# Altium schematic sheet Connector-Sheet.SchDoc
size A4; SheetNumber: 5; SheetTotal: 5
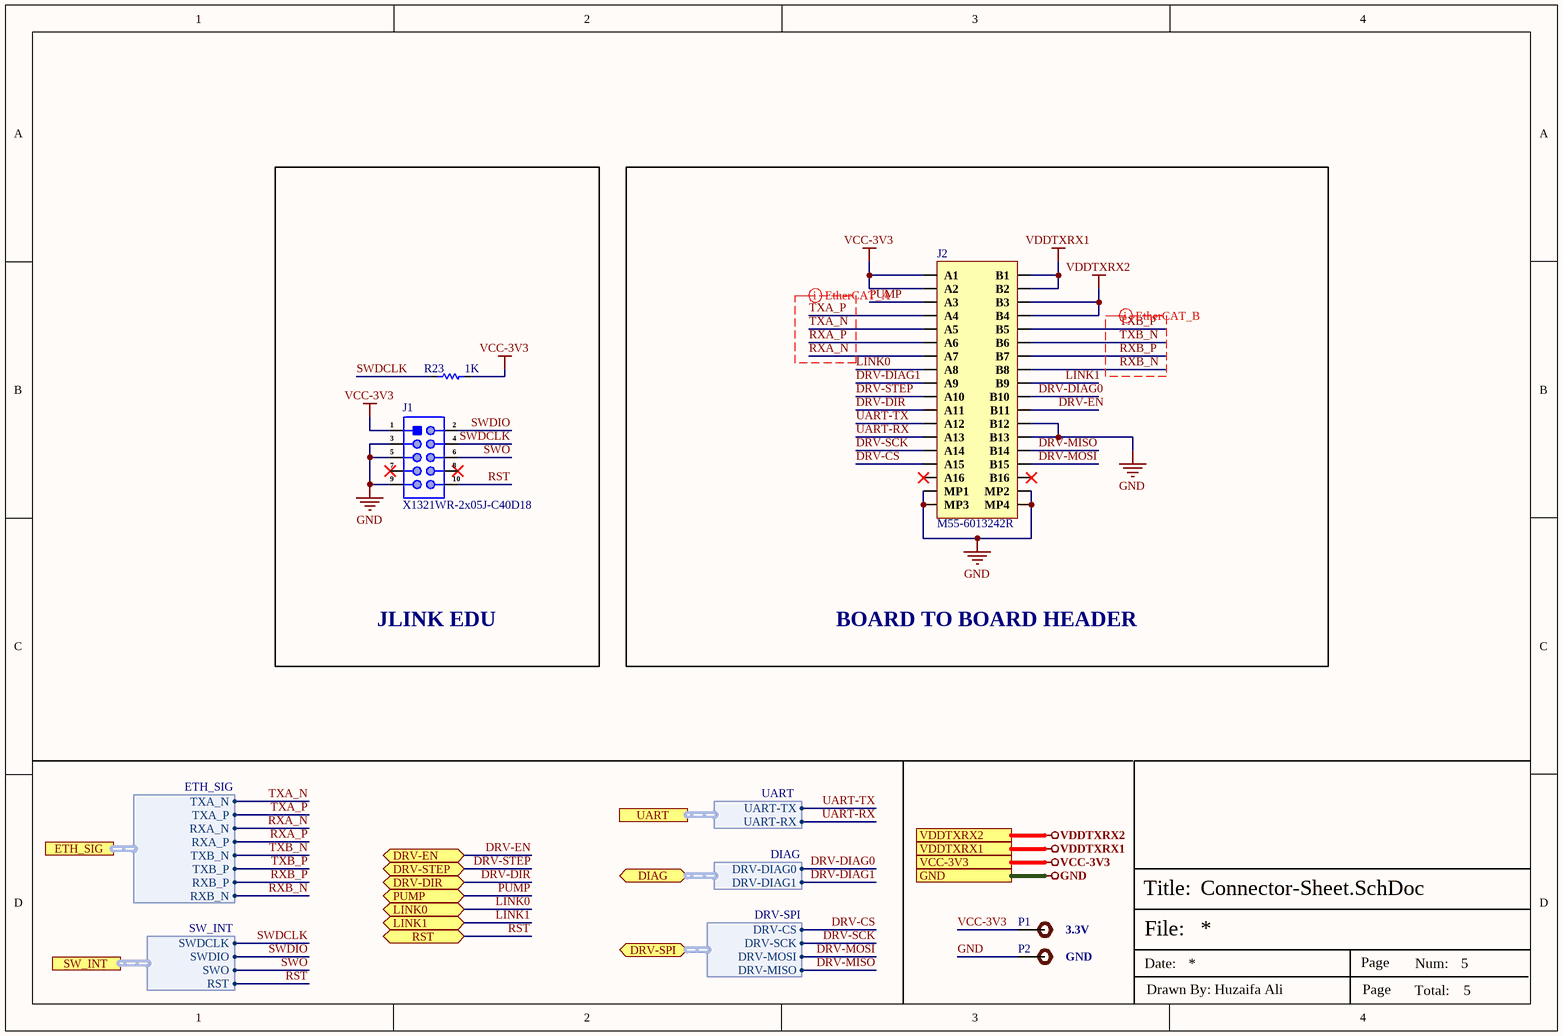
[diagram p0: Connector-Sheet.SchDoc]

## Parts
J1  X1321WR-2x05J-C40D18  [X1321WR-2x05J-C40D18]
J2  M55-6013242R  [M55-6013242R]
P1  TEST POINT  [Test-point]  (value not drawn)
P2  TEST POINT  [Test-point]  (value not drawn)
R23  1K  [Res-0201]

## Blocks framed on the sheet
JLINK EDU: J1 R23
BOARD TO BOARD HEADER: J2

## Ports
DIAG (bidir, harness DIAG, see Top-Sheet[3B], Controller-Sheet-2[2D]), DRV-DIR (bidir, see Top-Sheet[3B], Controller-Sheet-2[3D]), DRV-EN (bidir, see Top-Sheet[3B], Controller-Sheet-2[3D]), DRV-SPI (bidir, harness DRV-SPI, see Top-Sheet[3B], Controller-Sheet-2[2D]), DRV-STEP (bidir, see Top-Sheet[3B], Controller-Sheet-2[3D]), ETH_SIG (harness ETH_SIG, see Top-Sheet[3B], Controller-Sheet-2[1D]), GND (see Top-Sheet[3A], Controller-Sheet-1[2D], Controller-Sheet-2[3D], Encoder-Sheet[3D]), LINK0 (bidir, see Top-Sheet[3C], Controller-Sheet-1[3D]), LINK1 (bidir, see Top-Sheet[3C], Controller-Sheet-1[3D]), PUMP (bidir, see Top-Sheet[3B], Controller-Sheet-2[3D]), RST (bidir, see Top-Sheet[3B], Controller-Sheet-1[2D], Controller-Sheet-2[3D]), SW_INT (harness SW_INT, see Top-Sheet[3B], Controller-Sheet-2[2D]), UART (harness UART, see Top-Sheet[3B], Controller-Sheet-2[1D]), VCC-3V3 (see Top-Sheet[3B], Controller-Sheet-1[2D], Controller-Sheet-2[3D], Encoder-Sheet[2D]), VDDTXRX1 (see Top-Sheet[3B], Controller-Sheet-1[3D]), VDDTXRX2 (see Top-Sheet[3B], Controller-Sheet-1[3D])

## Harnesses
DIAG: DRV-DIAG0, DRV-DIAG1
DRV-SPI: DRV-CS, DRV-SCK, DRV-MOSI, DRV-MISO
UART: UART-TX, UART-RX
SW_INT: SWDCLK, SWDIO, SWO, RST
ETH_SIG: TXA_N, TXA_P, RXA_N, RXA_P, TXB_N, TXB_P, RXB_P, RXB_N

## Nets
GND: J1.3 J1.5 J1.9 J2.B12 J2.B13 J2.MP1 J2.MP2 J2.MP3 J2.MP4 P2.1 ; port GND
VCC-3V3: J1.1 J2.A1 J2.A2 P1.1 R23.2 ; port VCC-3V3
VDDTXRX1: J2.B1 J2.B2 ; port VDDTXRX1
VDDTXRX2: J2.B3 J2.B4 ; port VDDTXRX2
DRV-CS: J2.A15 ; port DRV-SPI.DRV-CS
DRV-DIAG0: J2.B10 ; port DIAG.DRV-DIAG0
DRV-DIAG1: J2.A9 ; port DIAG.DRV-DIAG1
DRV-DIR: J2.A11 ; port DRV-DIR
DRV-EN: J2.B11 ; port DRV-EN
DRV-MISO: J2.B14 ; port DRV-SPI.DRV-MISO
DRV-MOSI: J2.B15 ; port DRV-SPI.DRV-MOSI
DRV-SCK: J2.A14 ; port DRV-SPI.DRV-SCK
DRV-STEP: J2.A10 ; port DRV-STEP
LINK0: J2.A8 ; port LINK0
LINK1: J2.B9 ; port LINK1
PUMP: J2.A3 ; port PUMP
RST: J1.10 ; port RST, port SW_INT.RST
RXA_N: J2.A7 ; port ETH_SIG.RXA_N
RXA_P: J2.A6 ; port ETH_SIG.RXA_P
RXB_N: J2.B8 ; port ETH_SIG.RXB_N
RXB_P: J2.B7 ; port ETH_SIG.RXB_P
SWDCLK: J1.4 R23.1 ; port SW_INT.SWDCLK
SWDIO: J1.2 ; port SW_INT.SWDIO
SWO: J1.6 ; port SW_INT.SWO
TXA_N: J2.A5 ; port ETH_SIG.TXA_N
TXA_P: J2.A4 ; port ETH_SIG.TXA_P
TXB_N: J2.B6 ; port ETH_SIG.TXB_N
TXB_P: J2.B5 ; port ETH_SIG.TXB_P
UART-RX: J2.A13 ; port UART.UART-RX
UART-TX: J2.A12 ; port UART.UART-TX

Not connected (* = marked no-connect by the designer): J1 7* 8*; J2 A16* B16*

## Layout directives
differential pair; differential pair class EtherCAT_A_Lines; net class EtherCAT_A; rule Matched Net Lengths [Tolerance = 25.4mil]; rule Impedance Constraint [Min = 85.00    Max = 95.00    ]: RXA_N, RXA_P, TXA_N, TXA_P
differential pair; differential pair class EtherCAT_B_Lines; net class EtherCAT_B; rule Matched Net Lengths [Tolerance = 25.4mil]; rule Impedance Constraint [Min = 85.00    Max = 95.00    ]: RXB_N, RXB_P, TXB_N, TXB_P

## Notes on the sheet
- 3.3V
- GND
- File:
- Title:
- Date:
- Page
- Num:
- Total:
- Drawn By: Huzaifa Ali

## Library data of the parts
J1 = X1321WR-2x05J-C40D18: Gold 250V 1A Right-Angle Square Pins 1mm 10P 260℃ 4mm -40℃~+105℃ 1.27mm 双排 Black Brass 1.27mm 2x5P Push-Pull,P=1.27mm Pin Headers ROHS; Manufacturer: XKB; Item Type: Male Pin Header; Manufacturer Part Number: X1321WR-2x05J-C40D18; Package: Push-Pull,P=1.27mm; LCSC Part Number: C2881825; ComponentLink1Description: LCSC
J2 = M55-6013242R: CONN RCPT 1.27MM SMD 32POS; Manufacturer: Harwin; Item Type: Receptacle Connector; Supplier: Mouser; Supplier Part Number: 855-M55-6013242R; Manufacturer Part Number: M55-6013242R; RoHS: Yes; Category: Connectors; Stock: 3210; Pricing: 1=3.74, 10=3.21, 50=3.21, 100=2.99, 1000=2.11, 10000=2.01 (USD)
P1 P2 = TEST POINT: Test Point ON; Item Type: TEST POINT
R23 = RC0201FR-071KP: RES 1K OHM 1% 1/20W 0201; Manufacturer: Yageo; Supplier 1: Digi-Key; Manufacturer Part Number: RC0201FR-071KP; RoHS: Yes; Stock 1: 4800; Pricing 1: 1=0.11000, 10=0.10200, 100=0.03940, 1000=0.01734, 2500=0.01497, 5000=0.01340 (USD); RoHS Compliant: Yes; Supplier Part Number 1: 13-RC0201FR-071KPCT-ND; LCSC Part Number: C3953443